# EasyEDA Pro project realtix-sakura_nfc-d968f2f9.epro, schematic Schematic3
Board Name: 库洛牌_彩色丝印; Create Date: 2025-03-24; Page Name: P1; Project Name: 小樱nfc鸟头杖; Schematic Name: Schematic3; Update Date: 2025-03-24; Company: 嘉立创EDA; Page Size: A4; Version: V1.0
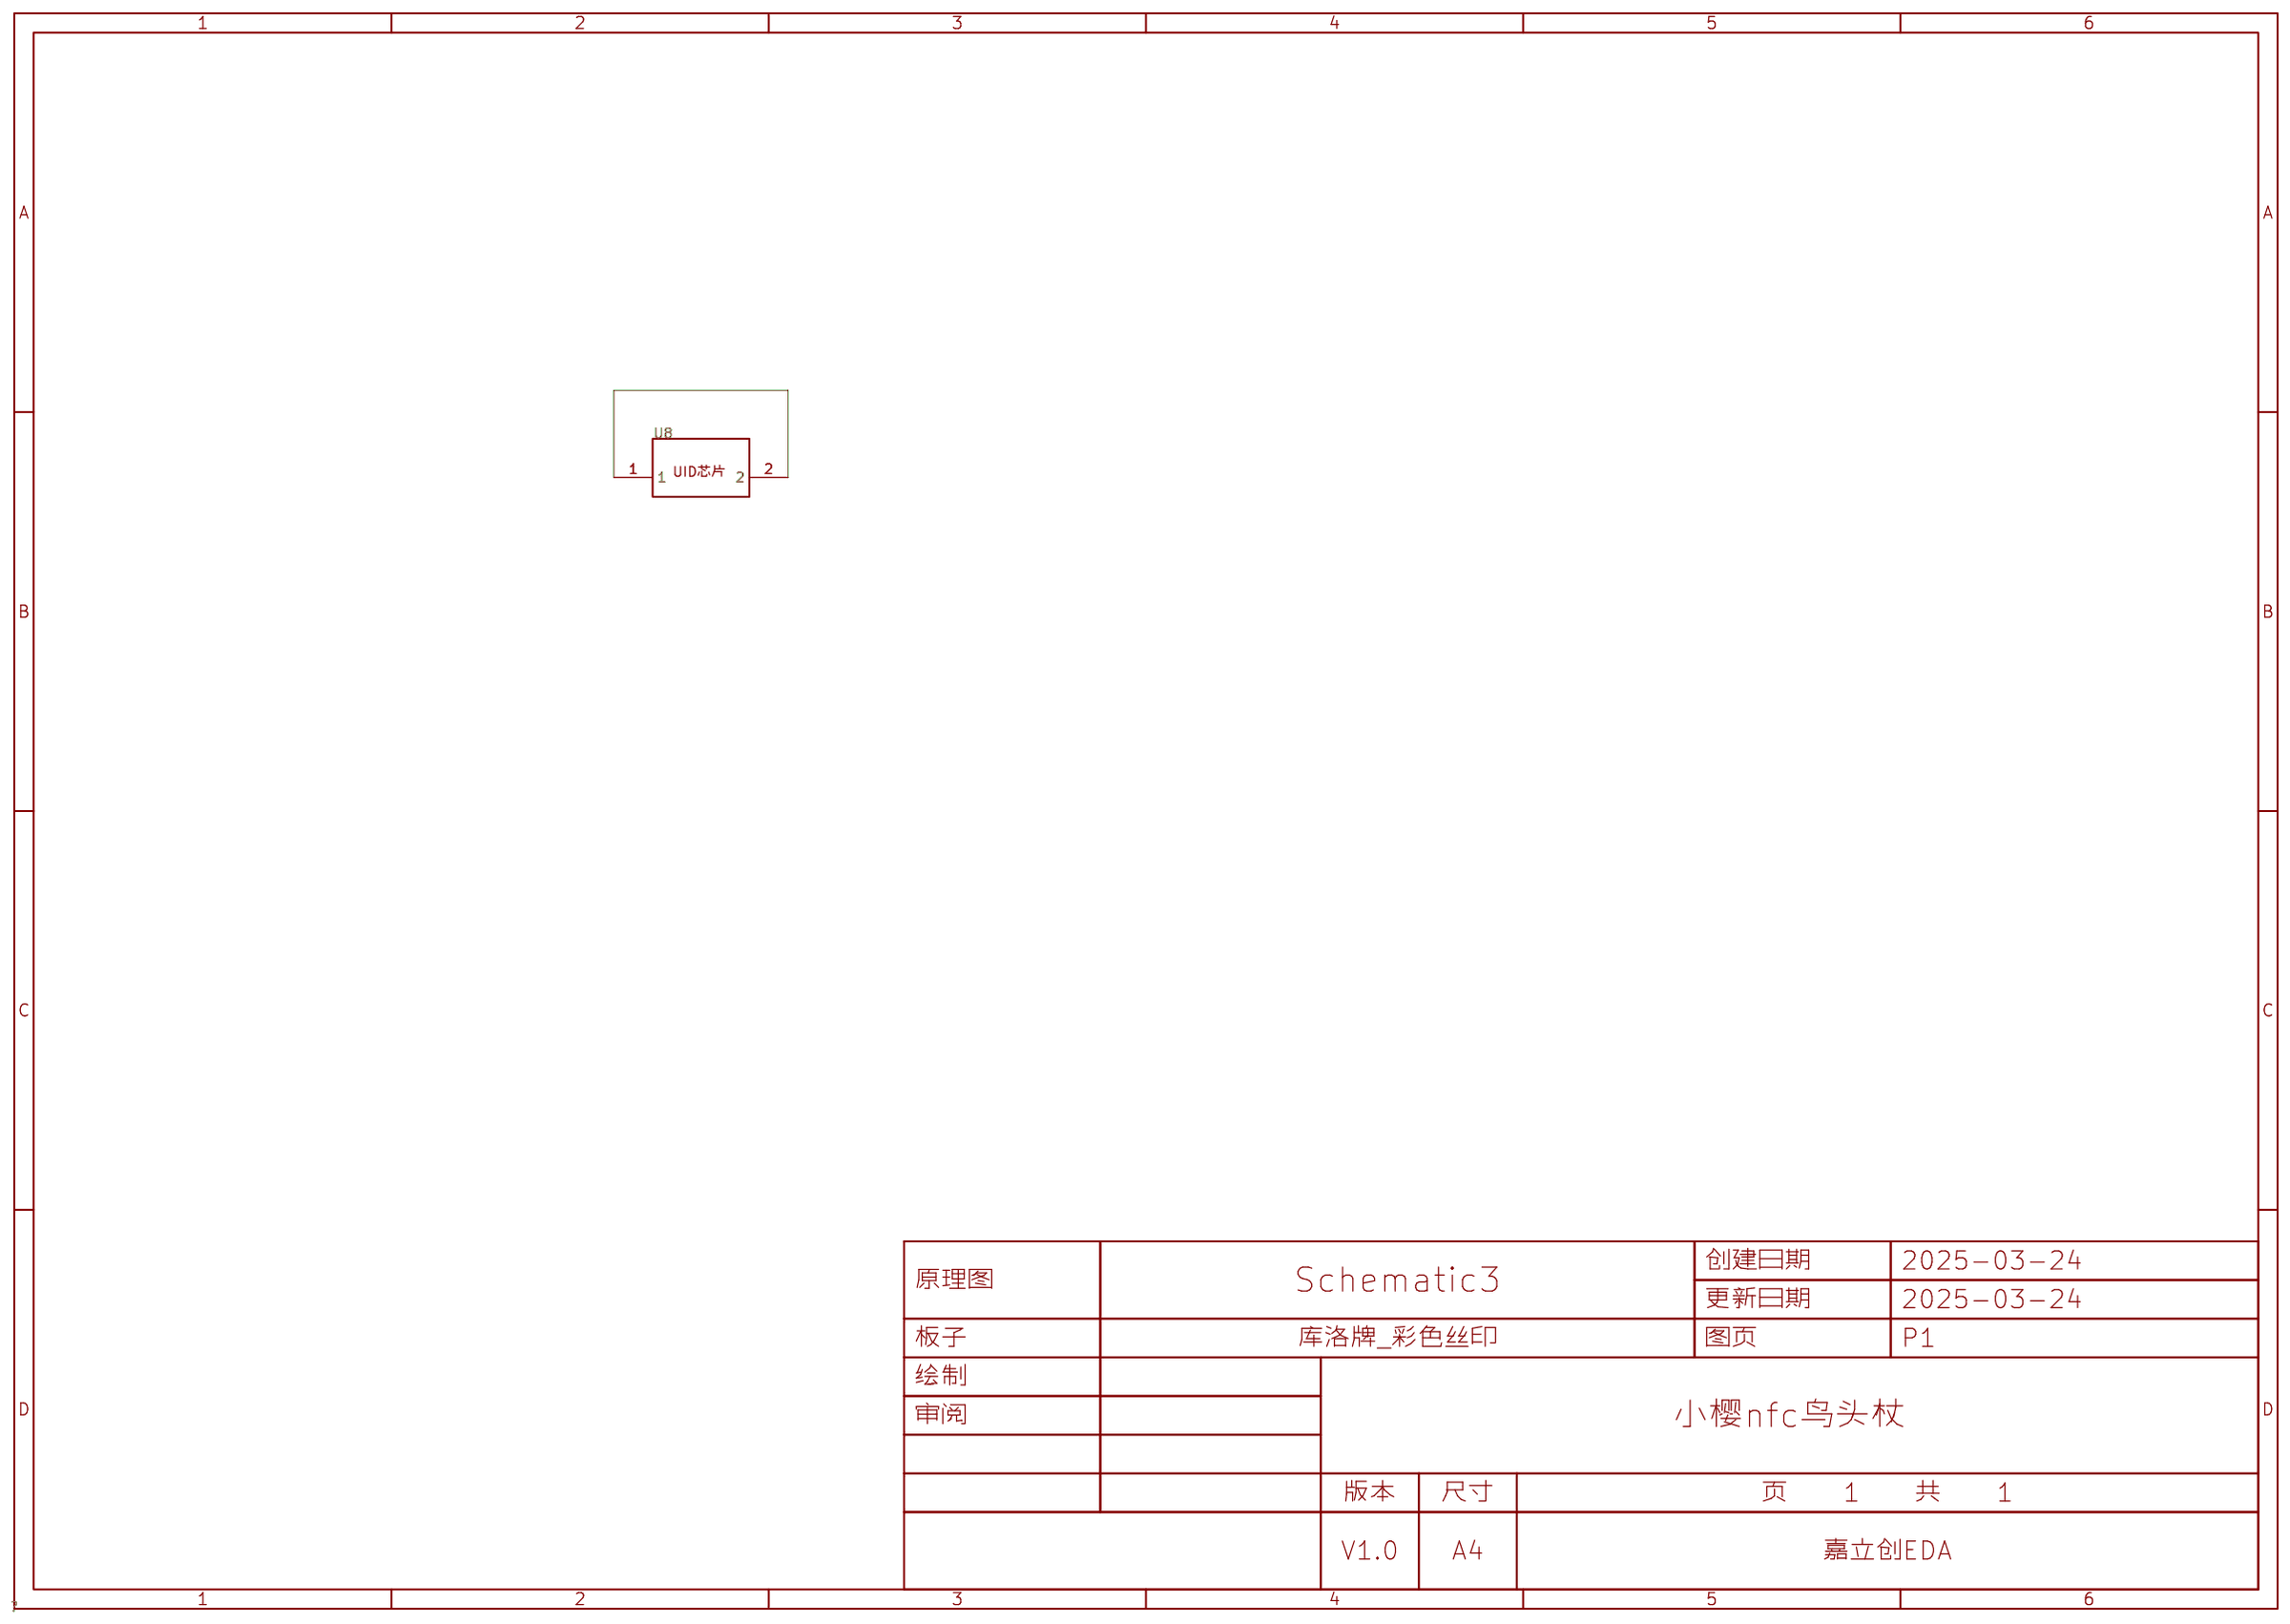
[diagram p2: schematic sheet]

## Parts
U8  -  [CUID-5X8]

## Library data of the parts
U8 = CUID-5X8

## Nets
$1N113: U8.1 U8.2
